# Altium project Camera-Controller-Board.PrjPcb (part 7 of 18)

## Sheet RK3588-Power.SchDoc
size 420 x 297 mm; SheetNumber: 4; SheetTotal: 22
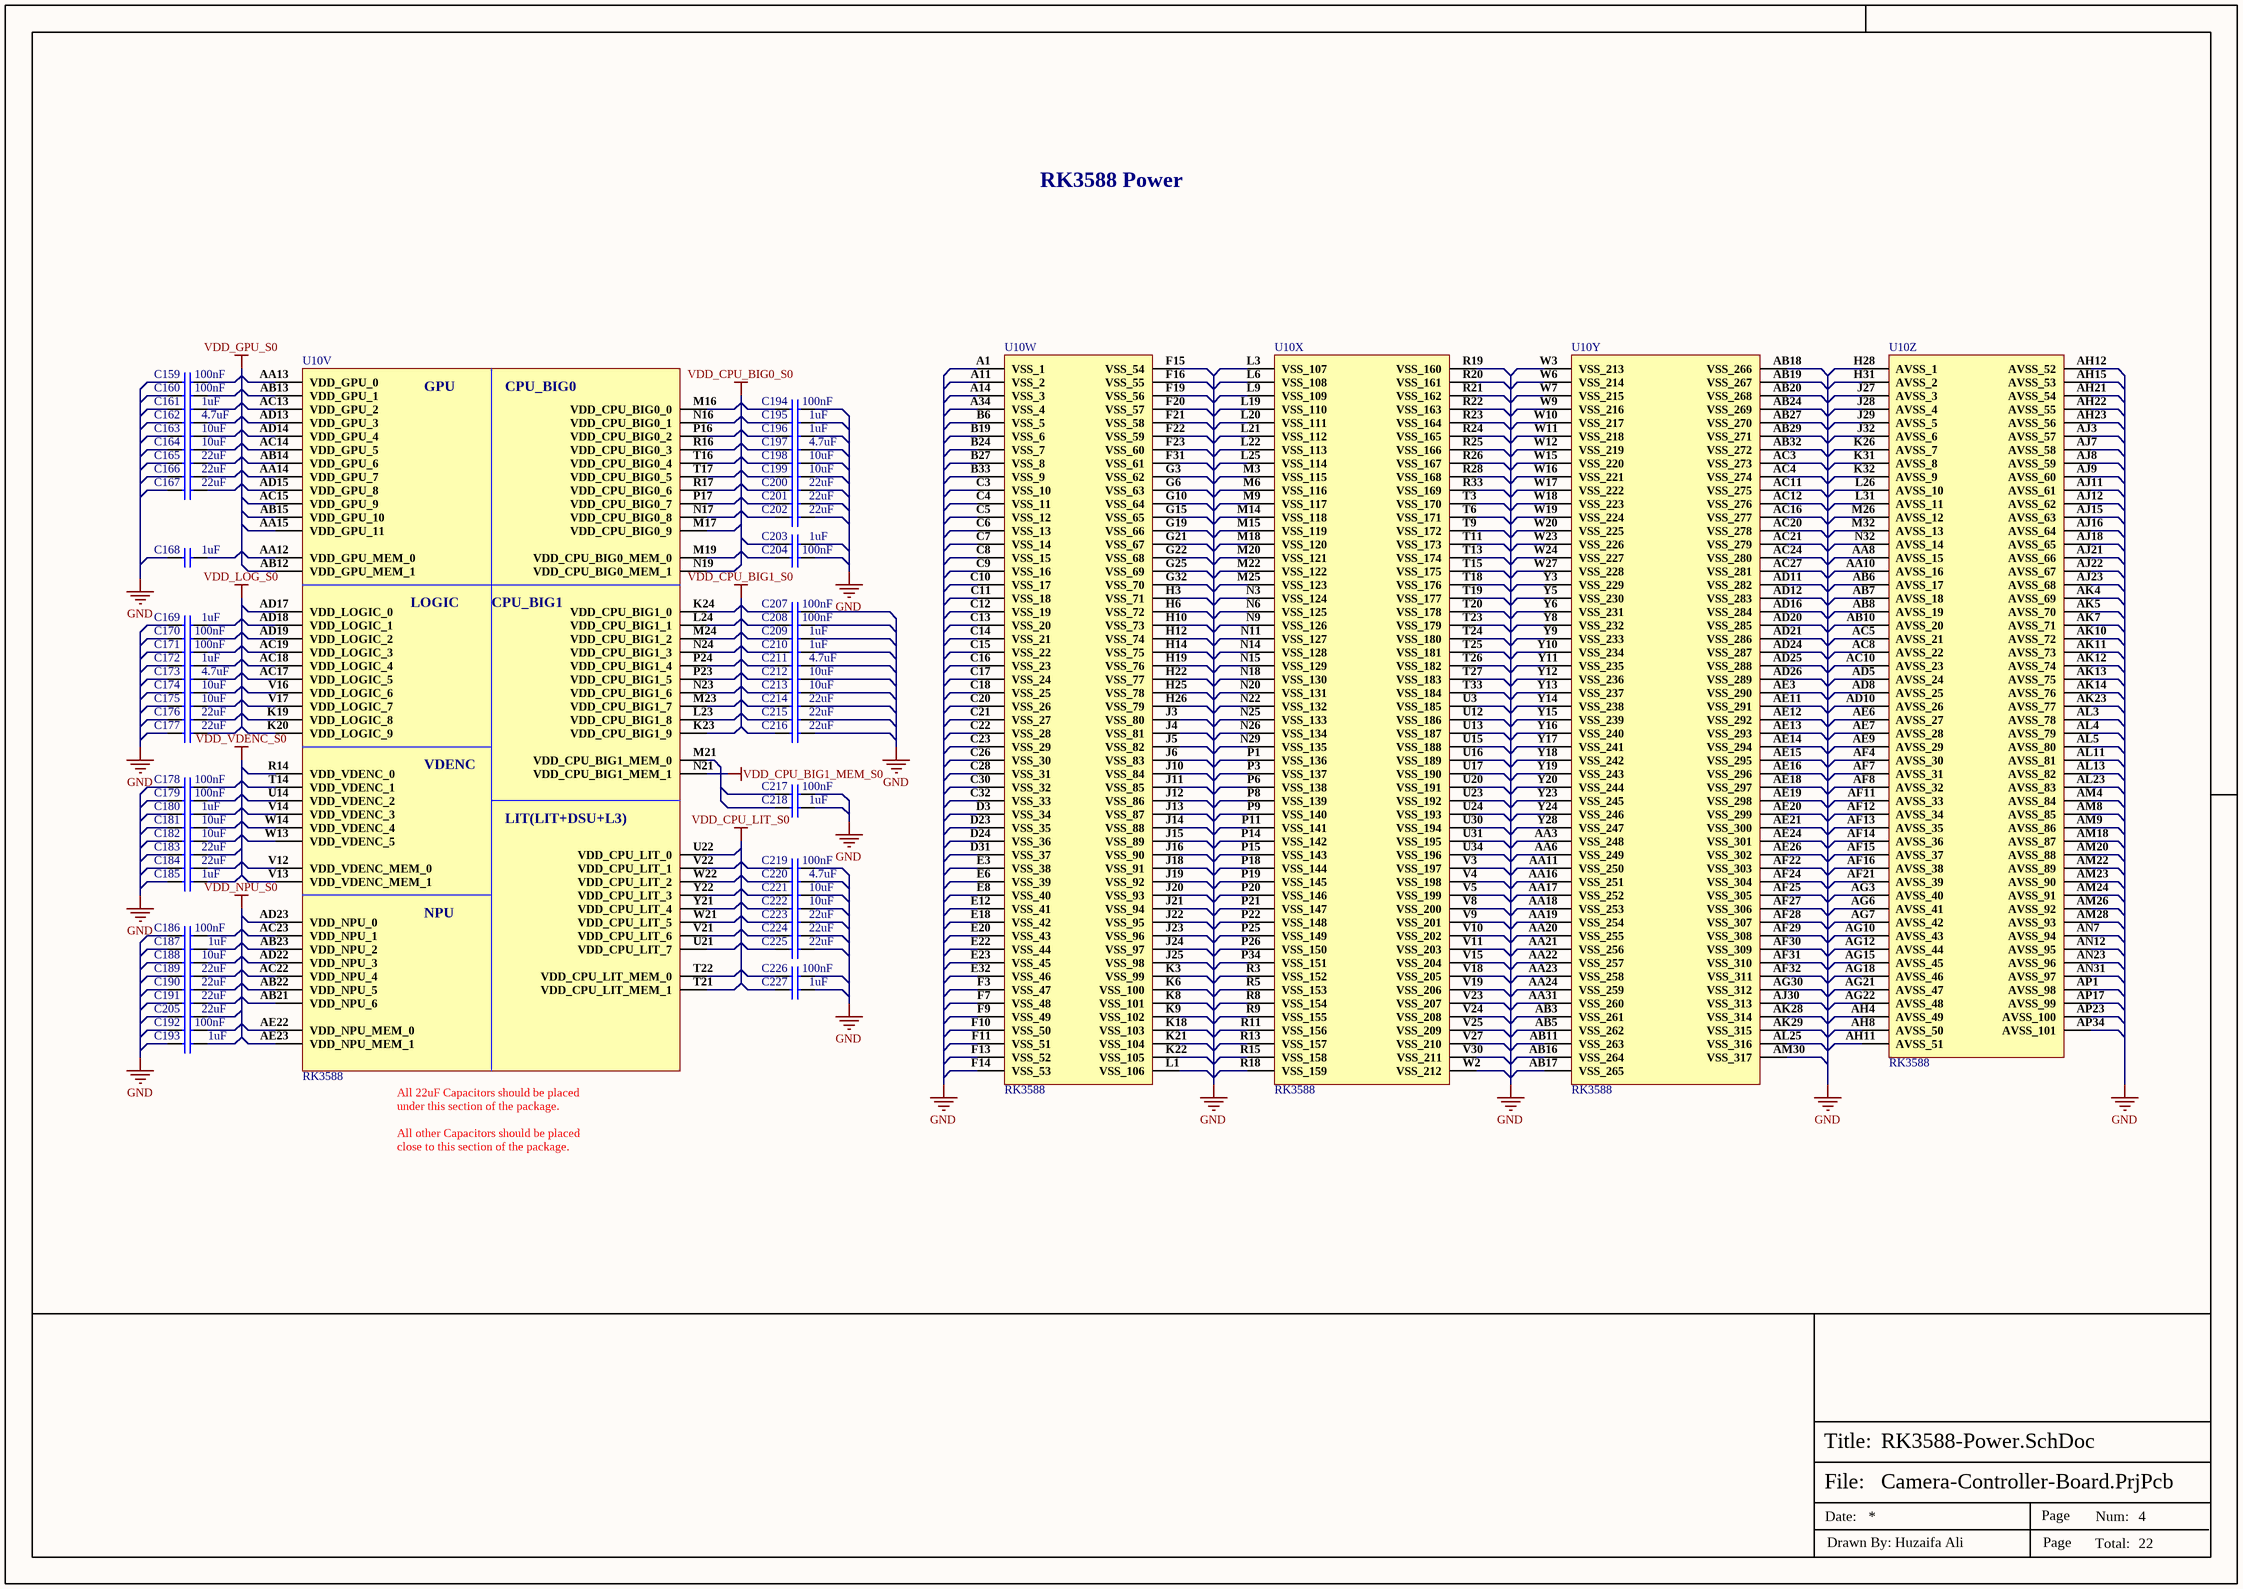
[diagram p3: RK3588-Power.SchDoc]

### Parts
C159  100nF  [CAP-0201]
C160  100nF  [CAP-0201]
C161  1uF  [CAP-0201]
C162  4.7uF  [Cap-0402]
C163  10uF  [Cap-0402]
C164  10uF  [Cap-0402]
C165  22uF  [Cap-0603]
C166  22uF  [Cap-0603]
C167  22uF  [Cap-0603]
C168  1uF  [CAP-0201]
C169  1uF  [CAP-0201]
C170  100nF  [CAP-0201]
C171  100nF  [CAP-0201]
C172  1uF  [CAP-0201]
C173  4.7uF  [Cap-0402]
C174  10uF  [Cap-0402]
C175  10uF  [Cap-0402]
C176  22uF  [Cap-0603]
C177  22uF  [Cap-0603]
C178  100nF  [CAP-0201]
C179  100nF  [CAP-0201]
C180  1uF  [CAP-0201]
C181  10uF  [Cap-0402]
C182  10uF  [Cap-0402]
C183  22uF  [Cap-0603]
C184  22uF  [Cap-0603]
C185  1uF  [CAP-0201]
C186  100nF  [CAP-0201]
C187  1uF  [CAP-0201]
C188  10uF  [Cap-0402]
C189  22uF  [Cap-0603]
C190  22uF  [Cap-0603]
C191  22uF  [Cap-0603]
C192  100nF  [CAP-0201]
C193  1uF  [CAP-0201]
C194  100nF  [CAP-0201]
C195  1uF  [CAP-0201]
C196  1uF  [CAP-0201]
C197  4.7uF  [Cap-0402]
C198  10uF  [Cap-0402]
C199  10uF  [Cap-0402]
C200  22uF  [Cap-0603]
C201  22uF  [Cap-0603]
C202  22uF  [Cap-0603]
C203  1uF  [CAP-0201]
C204  100nF  [CAP-0201]
C205  22uF  [Cap-0603]
C207  100nF  [CAP-0201]
C208  100nF  [CAP-0201]
C209  1uF  [CAP-0201]
C210  1uF  [CAP-0201]
C211  4.7uF  [Cap-0402]
C212  10uF  [Cap-0402]
C213  10uF  [Cap-0402]
C214  22uF  [Cap-0603]
C215  22uF  [Cap-0603]
C216  22uF  [Cap-0603]
C217  100nF  [CAP-0201]
C218  1uF  [CAP-0201]
C219  100nF  [CAP-0201]
C220  4.7uF  [Cap-0402]
C221  10uF  [Cap-0402]
C222  10uF  [Cap-0402]
C223  22uF  [Cap-0603]
C224  22uF  [Cap-0603]
C225  22uF  [Cap-0603]
C226  100nF  [CAP-0201]
C227  1uF  [CAP-0201]
U10  RK3588  [FCBGA-1088L]  (parts V,W,X,Y,Z of 26)

### Nets
GND: C159.1 C160.1 C161.1 C162.1 C163.1 C164.1 C165.1 C166.1 C167.1 C168.1 C169.1 C170.1 C171.1 C172.1 C173.1 C174.1 C175.1 C176.1 C177.1 C178.1 C179.1 C180.1 C181.1 C182.1 C183.1 C184.1 C185.1 C186.1 C187.1 C188.1 C189.1 C190.1 C191.1 C192.1 C193.1 C194.2 C195.2 C196.2 C197.2 C198.2 C199.2 C200.2 C201.2 C202.2 C203.2 C204.2 C205.1 C207.2 C208.2 C209.2 C210.2 C211.2 C212.2 C213.2 C214.2 C215.2 C216.2 C217.2 C218.2 C219.2 C220.2 C221.2 C222.2 C223.2 C224.2 C225.2 C226.2 C227.2 U10.A1(VSS_1) U10.A11(VSS_2) U10.A14(VSS_3) U10.A34(VSS_4) U10.AA3(VSS_248) U10.AA6(VSS_249) U10.AA8(AVSS_15) U10.AA10(AVSS_16) U10.AA11(VSS_250) U10.AA16(VSS_251) U10.AA17(VSS_252) U10.AA18(VSS_253) U10.AA19(VSS_254) U10.AA20(VSS_255) U10.AA21(VSS_256) U10.AA22(VSS_257) U10.AA23(VSS_258) U10.AA24(VSS_259) U10.AA31(VSS_260) U10.AB3(VSS_261) U10.AB5(VSS_262) U10.AB6(AVSS_17) U10.AB7(AVSS_18) U10.AB8(AVSS_19) U10.AB10(AVSS_20) U10.AB11(VSS_263) U10.AB16(VSS_264) U10.AB17(VSS_265) U10.AB18(VSS_266) U10.AB19(VSS_267) U10.AB20(VSS_268) U10.AB24(VSS_269) U10.AB27(VSS_270) U10.AB29(VSS_271) U10.AB32(VSS_272) U10.AC3(VSS_273) U10.AC4(VSS_274) U10.AC5(AVSS_21) U10.AC8(AVSS_22) U10.AC10(AVSS_23) U10.AC11(VSS_275) U10.AC12(VSS_276) U10.AC16(VSS_277) U10.AC20(VSS_278) U10.AC21(VSS_279) U10.AC24(VSS_280) U10.AC27(VSS_281) U10.AD5(AVSS_24) U10.AD8(AVSS_25) U10.AD10(AVSS_26) U10.AD11(VSS_282) U10.AD12(VSS_283) U10.AD16(VSS_284) U10.AD20(VSS_285) U10.AD21(VSS_286) U10.AD24(VSS_287) U10.AD25(VSS_288) U10.AD26(VSS_289) U10.AE3(VSS_290) U10.AE6(AVSS_27) U10.AE7(AVSS_28) U10.AE9(AVSS_29) U10.AE11(VSS_291) U10.AE12(VSS_292) U10.AE13(VSS_293) U10.AE14(VSS_294) U10.AE15(VSS_295) U10.AE16(VSS_296) U10.AE18(VSS_297) U10.AE19(VSS_298) U10.AE20(VSS_299) U10.AE21(VSS_300) U10.AE24(VSS_301) U10.AE26(VSS_302) U10.AF4(AVSS_30) U10.AF7(AVSS_31) U10.AF8(AVSS_32) U10.AF11(AVSS_33) U10.AF12(AVSS_34) U10.AF13(AVSS_35) U10.AF14(AVSS_36) U10.AF15(AVSS_37) U10.AF16(AVSS_38) U10.AF21(AVSS_39) U10.AF22(VSS_303) U10.AF24(VSS_304) U10.AF25(VSS_305) U10.AF27(VSS_306) U10.AF28(VSS_307) U10.AF29(VSS_308) U10.AF30(VSS_309) U10.AF31(VSS_310) U10.AF32(VSS_311) U10.AG3(AVSS_40) U10.AG6(AVSS_41) U10.AG7(AVSS_42) U10.AG10(AVSS_43) U10.AG12(AVSS_44) U10.AG15(AVSS_45) U10.AG18(AVSS_46) U10.AG21(AVSS_47) U10.AG22(AVSS_48) U10.AG30(VSS_312) U10.AH4(AVSS_49) U10.AH8(AVSS_50) U10.AH11(AVSS_51) U10.AH12(AVSS_52) U10.AH15(AVSS_53) U10.AH21(AVSS_54) U10.AH22(AVSS_55) U10.AH23(AVSS_56) U10.AJ3(AVSS_57) U10.AJ7(AVSS_58) U10.AJ8(AVSS_59) U10.AJ9(AVSS_60) U10.AJ11(AVSS_61) U10.AJ12(AVSS_62) U10.AJ15(AVSS_63) U10.AJ16(AVSS_64) U10.AJ18(AVSS_65) U10.AJ21(AVSS_66) U10.AJ22(AVSS_67) U10.AJ23(AVSS_68) U10.AJ30(VSS_313) U10.AK4(AVSS_69) U10.AK5(AVSS_70) U10.AK7(AVSS_71) U10.AK10(AVSS_72) U10.AK11(AVSS_73) U10.AK12(AVSS_74) U10.AK13(AVSS_75) U10.AK14(AVSS_76) U10.AK23(AVSS_77) U10.AK28(VSS_314) U10.AK29(VSS_315) U10.AL3(AVSS_78) U10.AL4(AVSS_79) U10.AL5(AVSS_80) U10.AL11(AVSS_81) U10.AL13(AVSS_82) U10.AL23(AVSS_83) U10.AL25(VSS_316) U10.AM4(AVSS_84) U10.AM8(AVSS_85) U10.AM9(AVSS_86) U10.AM18(AVSS_87) U10.AM20(AVSS_88) U10.AM22(AVSS_89) U10.AM23(AVSS_90) U10.AM24(AVSS_91) U10.AM26(AVSS_92) U10.AM28(AVSS_93) U10.AM30(VSS_317) U10.AN7(AVSS_94) U10.AN12(AVSS_95) U10.AN23(AVSS_96) U10.AN31(AVSS_97) U10.AP1(AVSS_98) U10.AP17(AVSS_99) U10.AP23(AVSS_100) U10.AP34(AVSS_101) U10.B6(VSS_5) U10.B19(VSS_6) U10.B24(VSS_7) U10.B27(VSS_8) U10.B33(VSS_9) U10.C3(VSS_10) U10.C4(VSS_11) U10.C5(VSS_12) U10.C6(VSS_13) U10.C7(VSS_14) U10.C8(VSS_15) U10.C9(VSS_16) U10.C10(VSS_17) U10.C11(VSS_18) U10.C12(VSS_19) U10.C13(VSS_20) U10.C14(VSS_21) U10.C15(VSS_22) U10.C16(VSS_23) U10.C17(VSS_24) U10.C18(VSS_25) U10.C20(VSS_26) U10.C21(VSS_27) U10.C22(VSS_28) U10.C23(VSS_29) U10.C26(VSS_30) U10.C28(VSS_31) U10.C30(VSS_32) U10.C32(VSS_33) U10.D3(VSS_34) U10.D23(VSS_35) U10.D24(VSS_36) U10.D31(VSS_37) U10.E3(VSS_38) U10.E6(VSS_39) U10.E8(VSS_40) U10.E12(VSS_41) U10.E18(VSS_42) U10.E20(VSS_43) U10.E22(VSS_44) U10.E23(VSS_45) U10.E32(VSS_46) U10.F3(VSS_47) U10.F7(VSS_48) U10.F9(VSS_49) U10.F10(VSS_50) U10.F11(VSS_51) U10.F13(VSS_52) U10.F14(VSS_53) U10.F15(VSS_54) U10.F16(VSS_55) U10.F19(VSS_56) U10.F20(VSS_57) U10.F21(VSS_58) U10.F22(VSS_59) U10.F23(VSS_60) U10.F31(VSS_61) U10.G3(VSS_62) U10.G6(VSS_63) U10.G10(VSS_64) U10.G15(VSS_65) U10.G19(VSS_66) U10.G21(VSS_67) U10.G22(VSS_68) U10.G25(VSS_69) U10.G32(VSS_70) U10.H3(VSS_71) U10.H6(VSS_72) U10.H10(VSS_73) U10.H12(VSS_74) U10.H14(VSS_75) U10.H19(VSS_76) U10.H22(VSS_77) U10.H25(VSS_78) U10.H26(VSS_79) U10.H28(AVSS_1) U10.H31(AVSS_2) U10.J3(VSS_80) U10.J4(VSS_81) U10.J5(VSS_82) U10.J6(VSS_83) U10.J10(VSS_84) U10.J11(VSS_85) U10.J12(VSS_86) U10.J13(VSS_87) U10.J14(VSS_88) U10.J15(VSS_89) U10.J16(VSS_90) U10.J18(VSS_91) U10.J19(VSS_92) U10.J20(VSS_93) U10.J21(VSS_94) U10.J22(VSS_95) U10.J23(VSS_96) U10.J24(VSS_97) U10.J25(VSS_98) U10.J27(AVSS_3) U10.J28(AVSS_4) U10.J29(AVSS_5) U10.J32(AVSS_6) U10.K3(VSS_99) U10.K6(VSS_100) U10.K8(VSS_101) U10.K9(VSS_102) U10.K18(VSS_103) U10.K21(VSS_104) U10.K22(VSS_105) U10.K26(AVSS_7) U10.K31(AVSS_8) U10.K32(AVSS_9) U10.L1(VSS_106) U10.L3(VSS_107) U10.L6(VSS_108) U10.L9(VSS_109) U10.L19(VSS_110) U10.L20(VSS_111) U10.L21(VSS_112) U10.L22(VSS_113) U10.L25(VSS_114) U10.L26(AVSS_10) U10.L31(AVSS_11) U10.M3(VSS_115) U10.M6(VSS_116) U10.M9(VSS_117) U10.M14(VSS_118) U10.M15(VSS_119) U10.M18(VSS_120) U10.M20(VSS_121) U10.M22(VSS_122) U10.M25(VSS_123) U10.M26(AVSS_12) U10.M32(AVSS_13) U10.N3(VSS_124) U10.N6(VSS_125) U10.N9(VSS_126) U10.N11(VSS_127) U10.N14(VSS_128) U10.N15(VSS_129) U10.N18(VSS_130) U10.N20(VSS_131) U10.N22(VSS_132) U10.N25(VSS_133) U10.N26(VSS_134) U10.N29(VSS_135) U10.N32(AVSS_14) U10.P1(VSS_136) U10.P3(VSS_137) U10.P6(VSS_138) U10.P8(VSS_139) U10.P9(VSS_140) U10.P11(VSS_141) U10.P14(VSS_142) U10.P15(VSS_143) U10.P18(VSS_144) U10.P19(VSS_145) U10.P20(VSS_146) U10.P21(VSS_147) U10.P22(VSS_148) U10.P25(VSS_149) U10.P26(VSS_150) U10.P34(VSS_151) U10.R3(VSS_152) U10.R5(VSS_153) U10.R8(VSS_154) U10.R9(VSS_155) U10.R11(VSS_156) U10.R13(VSS_157) U10.R15(VSS_158) U10.R18(VSS_159) U10.R19(VSS_160) U10.R20(VSS_161) U10.R21(VSS_162) U10.R22(VSS_163) U10.R23(VSS_164) U10.R24(VSS_165) U10.R25(VSS_166) U10.R26(VSS_167) U10.R28(VSS_168) U10.R33(VSS_169) U10.T3(VSS_170) U10.T6(VSS_171) U10.T9(VSS_172) U10.T11(VSS_173) U10.T13(VSS_174) U10.T15(VSS_175) U10.T18(VSS_176) U10.T19(VSS_177) U10.T20(VSS_178) U10.T23(VSS_179) U10.T24(VSS_180) U10.T25(VSS_181) U10.T26(VSS_182) U10.T27(VSS_183) U10.T33(VSS_184) U10.U3(VSS_185) U10.U12(VSS_186) U10.U13(VSS_187) U10.U15(VSS_188) U10.U16(VSS_189) U10.U17(VSS_190) U10.U20(VSS_191) U10.U23(VSS_192) U10.U24(VSS_193) U10.U30(VSS_194) U10.U31(VSS_195) U10.U34(VSS_196) U10.V3(VSS_197) U10.V4(VSS_198) U10.V5(VSS_199) U10.V8(VSS_200) U10.V9(VSS_201) U10.V10(VSS_202) U10.V11(VSS_203) U10.V15(VSS_204) U10.V18(VSS_205) U10.V19(VSS_206) U10.V23(VSS_207) U10.V24(VSS_208) U10.V25(VSS_209) U10.V27(VSS_210) U10.V30(VSS_211) U10.W2(VSS_212) U10.W3(VSS_213) U10.W6(VSS_214) U10.W7(VSS_215) U10.W9(VSS_216) U10.W10(VSS_217) U10.W11(VSS_218) U10.W12(VSS_219) U10.W15(VSS_220) U10.W16(VSS_221) U10.W17(VSS_222) U10.W18(VSS_223) U10.W19(VSS_224) U10.W20(VSS_225) U10.W23(VSS_226) U10.W24(VSS_227) U10.W27(VSS_228) U10.Y3(VSS_229) U10.Y5(VSS_230) U10.Y6(VSS_231) U10.Y8(VSS_232) U10.Y9(VSS_233) U10.Y10(VSS_234) U10.Y11(VSS_235) U10.Y12(VSS_236) U10.Y13(VSS_237) U10.Y14(VSS_238) U10.Y15(VSS_239) U10.Y16(VSS_240) U10.Y17(VSS_241) U10.Y18(VSS_242) U10.Y19(VSS_243) U10.Y20(VSS_244) U10.Y23(VSS_245) U10.Y24(VSS_246) U10.Y28(VSS_247)
VDD_CPU_BIG0_S0: C194.1 C195.1 C196.1 C197.1 C198.1 C199.1 C200.1 C201.1 C202.1 C203.1 C204.1 U10.M16(VDD_CPU_BIG0_0) U10.M17(VDD_CPU_BIG0_9) U10.M19(VDD_CPU_BIG0_MEM_0) U10.N16(VDD_CPU_BIG0_1) U10.N17(VDD_CPU_BIG0_8) U10.N19(VDD_CPU_BIG0_MEM_1) U10.P16(VDD_CPU_BIG0_2) U10.P17(VDD_CPU_BIG0_7) U10.R16(VDD_CPU_BIG0_3) U10.R17(VDD_CPU_BIG0_6) U10.T16(VDD_CPU_BIG0_4) U10.T17(VDD_CPU_BIG0_5)
VDD_CPU_BIG1_MEM_S0: C217.1 C218.1 U10.M21(VDD_CPU_BIG1_MEM_0) U10.N21(VDD_CPU_BIG1_MEM_1)
VDD_CPU_BIG1_S0: C207.1 C208.1 C209.1 C210.1 C211.1 C212.1 C213.1 C214.1 C215.1 C216.1 U10.K23(VDD_CPU_BIG1_9) U10.K24(VDD_CPU_BIG1_0) U10.L23(VDD_CPU_BIG1_8) U10.L24(VDD_CPU_BIG1_1) U10.M23(VDD_CPU_BIG1_7) U10.M24(VDD_CPU_BIG1_2) U10.N23(VDD_CPU_BIG1_6) U10.N24(VDD_CPU_BIG1_3) U10.P23(VDD_CPU_BIG1_5) U10.P24(VDD_CPU_BIG1_4)
VDD_CPU_LIT_S0: C219.1 C220.1 C221.1 C222.1 C223.1 C224.1 C225.1 C226.1 C227.1 U10.T21(VDD_CPU_LIT_MEM_1) U10.T22(VDD_CPU_LIT_MEM_0) U10.U21(VDD_CPU_LIT_7) U10.U22(VDD_CPU_LIT_0) U10.V21(VDD_CPU_LIT_6) U10.V22(VDD_CPU_LIT_1) U10.W21(VDD_CPU_LIT_5) U10.W22(VDD_CPU_LIT_2) U10.Y21(VDD_CPU_LIT_4) U10.Y22(VDD_CPU_LIT_3)
VDD_GPU_S0: C159.2 C160.2 C161.2 C162.2 C163.2 C164.2 C165.2 C166.2 C167.2 C168.2 U10.AA12(VDD_GPU_MEM_0) U10.AA13(VDD_GPU_0) U10.AA14(VDD_GPU_7) U10.AA15(VDD_GPU_11) U10.AB12(VDD_GPU_MEM_1) U10.AB13(VDD_GPU_1) U10.AB14(VDD_GPU_6) U10.AB15(VDD_GPU_10) U10.AC13(VDD_GPU_2) U10.AC14(VDD_GPU_5) U10.AC15(VDD_GPU_9) U10.AD13(VDD_GPU_3) U10.AD14(VDD_GPU_4) U10.AD15(VDD_GPU_8)
VDD_LOG_S0: C169.2 C170.2 C171.2 C172.2 C173.2 C174.2 C175.2 C176.2 C177.2 U10.AC17(VDD_LOGIC_5) U10.AC18(VDD_LOGIC_4) U10.AC19(VDD_LOGIC_3) U10.AD17(VDD_LOGIC_0) U10.AD18(VDD_LOGIC_1) U10.AD19(VDD_LOGIC_2) U10.K19(VDD_LOGIC_8) U10.K20(VDD_LOGIC_9) U10.V16(VDD_LOGIC_6) U10.V17(VDD_LOGIC_7)
VDD_NPU_S0: C186.2 C187.2 C188.2 C189.2 C190.2 C191.2 C192.2 C193.2 C205.2 U10.AB21(VDD_NPU_6) U10.AB22(VDD_NPU_5) U10.AB23(VDD_NPU_2) U10.AC22(VDD_NPU_4) U10.AC23(VDD_NPU_1) U10.AD22(VDD_NPU_3) U10.AD23(VDD_NPU_0) U10.AE22(VDD_NPU_MEM_0) U10.AE23(VDD_NPU_MEM_1)
VDD_VDENC_S0: C178.2 C179.2 C180.2 C181.2 C182.2 C183.2 C184.2 C185.2 U10.R14(VDD_VDENC_0) U10.T14(VDD_VDENC_1) U10.U14(VDD_VDENC_2) U10.V12(VDD_VDENC_MEM_0) U10.V13(VDD_VDENC_MEM_1) U10.V14(VDD_VDENC_3) U10.W13(VDD_VDENC_5) U10.W14(VDD_VDENC_4)

### Notes on the sheet
- RK3588 Power
- (near U10) All 22uF Capacitors should be placed under this section of the package.
  All other Capacitors should be placed close to this section of the package.
- File:
- Title:
- Date:
- Page
- Num:
- Total:
- Drawn By: Huzaifa Ali
- (in symbol RK3588, part V) GPU; CPU_BIG0; LOGIC; CPU_BIG1; VDENC; LIT(LIT+DSU+L3); NPU

### Library data of the parts
C159 C160 C170 C171 C178 C179 C186 C192 C194 C204 C207 C208 C217 C219 C226 = CC0201KRX5R6BB104: CAP CER 0.1UF 10V X5R 0201; Manufacturer: Yageo; Tolerance: 10%; Supplier 1: Mouser; Manufacturer Part Number: CC0201KRX5R6BB104; RoHS: Yes; Category: Ceramic Capacitors; Stock 1: 824403; Pricing 1: 1=0.10000, 10=0.02400, 50=0.02400, 100=0.01900, 1000=0.01100, 10000=0.00900 (USD); Mount: Surface Mount; Case/Package: 0201; Case Code (Imperial): 0201; Case Code (Metric): 0603; Weight: 6E-06oz; Min Operating Temperature: -55°C; Max Operating Temperature: 85°C; Capacitance: 100nF; Dielectric: X5R; Voltage Rating (DC): 10V; Packaging: Tape and Reel; Termination: SMD/SMT; Resistor Type: Ceramic; Voltage Rating: 10V; Series: CC; Construction: Flat; Length: 0.6mm; Width: 0.012inch; Height: 0.3mm; Thickness: 0.013inch; Depth: 0.3mm; Radiation Hardening: No; Lead Free: Lead Free; Halogen Free: Halogen Free; RoHS Compliant: Yes; ComponentLink1URL: https://datasheet.ciiva.com/11587/upy-gphc-x5r-4v-to-50v-12-11587190.pdf?src-supplier=Avnet; ComponentLink1Description: https://datasheet.ciiva.com/11587/upy-gphc-x5r-4v-to-50v-12-11587190.pdf?src-supplier=Avnet; Supplier Part Number 1: 603-CC201KRX5R6BB104; LCSC Part Number: C190183
C161 C168 C169 C172 C180 C185 C187 C193 C195 C196 C203 C209 C210 C218 C227 = CC0201KRX5R5BB105: CAP CER 1UF 6.3V X5R 0201; Manufacturer: Yageo; Tolerance: 10%; Supplier 1: Digi-Key; Manufacturer Part Number: CC0201KRX5R5BB105; RoHS: Yes; Category: Ceramic Capacitors; Stock 1: 1911543; Pricing 1: 1=0.10000, 10=0.04600, 50=0.02500, 100=0.02050, 500=0.01464, 1000=0.01150, 2500=0.01045, 5000=0.00962 (USD); Mount: Surface Mount; Case/Package: 0201; Case Code (Imperial): 0201; Case Code (Metric): 0603; Min Operating Temperature: -55°C; Max Operating Temperature: 85°C; Packaging: Cut Tape; Capacitance: 1uF; Voltage Rating: 6.3V; RoHS Compliant: Yes; ComponentLink1URL: http://www.yageo.com/documents/recent/UPY-GPHC_X5R_4V-to-50V_25.pdf?src-supplier=Digi-Key; ComponentLink1Description: http://www.yageo.com/documents/recent/UPY-GPHC_X5R_4V-to-50V_25.pdf?src-supplier=Digi-Key; ComponentLink2URL: https://www.yageo.com/upload/media/product/productsearch/datasheet/mlcc/UPY-GPHC_X5R_4V-to-50V_26.pdf?src-supplier=Digi-Key; ComponentLink2Description: https://www.yageo.com/upload/media/product/productsearch/datasheet/mlcc/UPY-GPHC_X5R_4V-to-50V_26.pdf?src-supplier=Digi-Key; Supplier Part Number 1: 311-3471-1-ND
C162 C173 C197 C211 C220 = CC0402KRX5R5BB475: CAP CER 4.7UF 6.3V X5R 0402; Manufacturer: Yageo; Tolerance: 10%; Supplier 1: Digi-Key; Manufacturer Part Number: CC0402KRX5R5BB475; RoHS: Yes; Category: Ceramic Capacitors; Stock 1: 1127839; Pricing 1: 1=0.19000, 10=0.12700, 50=0.07600, 100=0.06420, 500=0.04396, 1000=0.03889, 2500=0.03720, 5000=0.03381 (USD); Case/Package: 0402; Voltage Rating (DC): 6.3V; Dielectric: X5R; Capacitance: 4.7uF; Lead Free: Lead Free; Halogen Free: Halogen Free; RoHS Compliant: Yes; ComponentLink1URL: http://www.yageo.com/documents/recent/UPY-GPHC_X5R_4V-to-50V_25.pdf?src-supplier=Digi-Key; ComponentLink1Description: http://www.yageo.com/documents/recent/UPY-GPHC_X5R_4V-to-50V_25.pdf?src-supplier=Digi-Key; ComponentLink2URL: https://www.yageo.com/upload/media/product/productsearch/datasheet/mlcc/UPY-GPHC_X5R_4V-to-50V_26.pdf?src-supplier=Digi-Key; ComponentLink2Description: https://www.yageo.com/upload/media/product/productsearch/datasheet/mlcc/UPY-GPHC_X5R_4V-to-50V_26.pdf?src-supplier=Digi-Key; Supplier Part Number 1: 311-3476-1-ND
C163 C164 C174 C175 C181 C182 C188 C198 C199 C212 C213 C221 C222 = AMK105CBJ106MV-F: CAP CER 10UF 4V X5R 0402; Manufacturer: Taiyo Yuden; Tolerance: 20%; Item Type: Capacitor; Supplier 1: Mouser; Manufacturer Part Number: AMK105CBJ106MV-F; RoHS: Yes; Category: Ceramic Capacitors; Stock 1: 507215; Pricing 1: 1=0.23000, 10=0.10300, 50=0.10300, 100=0.07800, 1000=0.04700, 10000=0.03900 (USD); Mount: Surface Mount; Case/Package: 0402; Case Code (Imperial): 0402; Case Code (Metric): 1005; Min Operating Temperature: -55°C; Max Operating Temperature: 85°C; Capacitance: 10uF; Dielectric: X5R; Package Quantity: 1; Packaging: Tape and Reel; Termination: SMD/SMT; Voltage Rating (DC): 4V; Voltage Rating: 4V; Series: M; Construction: Flat; Length: 0.039inch; Width: 0.02inch; Height: 0.5mm; Thickness: 0.028inch; RoHS Compliant: Yes; REACH SVHC: Unknown; Halogen Free: Halogen Free; ComponentLink1URL: https://datasheet.ciiva.com/6255/amk105cbj106mv-f-ss-6255363.pdf?src-supplier=Digi-Key; ComponentLink1Description: https://datasheet.ciiva.com/6255/amk105cbj106mv-f-ss-6255363.pdf?src-supplier=Digi-Key; ComponentLink2URL: https://datasheet.ciiva.com/30133/411amk105cbj106mv-f-30133635.pdf?src-supplier=Onlinecomponents.com; ComponentLink2Description: https://datasheet.ciiva.com/30133/411amk105cbj106mv-f-30133635.pdf?src-supplier=Onlinecomponents.com; ComponentLink3URL: https://datasheet.ciiva.com/15916/2amk105cbj106mv-f-15916827.pdf?src-supplier=Onlinecomponents.com; ComponentLink3Description: https://datasheet.ciiva.com/15916/2amk105cbj106mv-f-15916827.pdf?src-supplier=Onlinecomponents.com; Supplier Part Number 1: 963-AMK105CBJ106MV-F; LCSC Part Number: C454073
C165-C167 C176 C177 C183 C184 C189-C191 C200-C202 C205 C214-C216 C223-C225 = CC0603MRX5R5BB226: as C58 on sheet Power-Sheet-2; Supplier 1: Mouser; Manufacturer Part Number: CC0603MRX5R5BB226; RoHS: Yes; Category: Ceramic Capacitors; Stock 1: 3030; Pricing 1: 1=0.33000, 10=0.22500, 50=0.22500, 100=0.12800, 1000=0.07900, 10000=0.06500 (USD); Mount: Surface Mount; Case/Package: 0603; Case Code (Metric): 1608; Case Code (Imperial): 0603; Weight: 7.1E-05oz; Min Operating Temperature: -55°C; Max Operating Temperature: 85°C; Capacitance: 22uF; Packaging: Tape and Reel; Dielectric: X5R; Voltage Rating: 6.3V; Termination: SMD/SMT; Resistor Type: Ceramic; Voltage Rating (DC): 6.3V; Package Quantity: 4000; Length: 0.063inch; Width: 0.031inch; Thickness: 0.035inch; Depth: 0.8mm; Lead Free: Lead Free; Halogen Free: Halogen Free; RoHS Compliant: Yes; ComponentLink1URL: http://www.mouser.com/ds/2/447/Yageo_UPY-GP_NP0_16V-to-50V_9-358835.pdf?src-supplier=Mouser; ComponentLink1Description: http://www.mouser.com/ds/2/447/Yageo_UPY-GP_NP0_16V-to-50V_9-358835.pdf?src-supplier=Mouser; ComponentLink2URL: http://www.yageo.com/documents/recent/UPY-GPHC_X5R_4V-to-50V_25.pdf?src-supplier=Digi-Key; ComponentLink2Description: http://www.yageo.com/documents/recent/UPY-GPHC_X5R_4V-to-50V_25.pdf?src-supplier=Digi-Key; Supplier Part Number 1: 603-CC603MRX5R5BB226; LCSC Part Number: C109448
U10 = RK3588: Power Management IC; Manufacturer Part Number: RK3588LP4XEVB; Manufacturer: Rockchip; LCSC Part Number: *; Item Type: IC